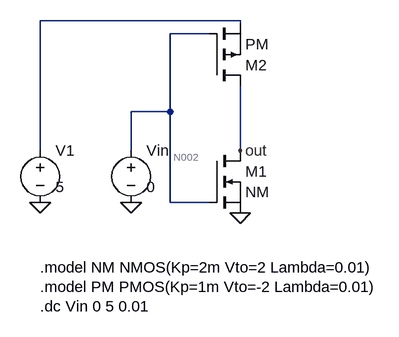
[diagram p0: schematic Ex12.asc]
Ex12.asc, the LTspice schematic file:
Version 4
SHEET 1 880 680
WIRE 60 200 60 0
WIRE 60 0 368 0
WIRE 368 0 368 4
WIRE 368 100 368 200
WIRE 200 200 200 140
WIRE 200 140 260 140
WIRE 260 140 260 20
WIRE 260 20 320 20
WIRE 260 140 260 280
WIRE 260 280 320 280
FLAG 368 200 out
FLAG 60 280 0
FLAG 200 280 0
FLAG 368 296 0
SYMBOL voltage 60 184 R0
WINDOW 0 24 16 Left 2
WINDOW 3 24 72 Left 2
SYMATTR InstName V1
SYMATTR Value 5
SYMBOL voltage 200 184 R0
WINDOW 0 24 16 Left 2
WINDOW 3 24 72 Left 2
SYMATTR InstName Vin
SYMATTR Value 0
SYMBOL pmos 320 100 M180
WINDOW 0 56 32 Left 2
WINDOW 3 56 64 Left 2
SYMATTR InstName M2
SYMATTR Value PM
SYMBOL nmos 320 200 R0
WINDOW 0 56 32 Left 2
WINDOW 3 56 64 Left 2
SYMATTR InstName M1
SYMATTR Value NM
TEXT 60 380 Left 2 !.model NM NMOS(Kp=2m Vto=2 Lambda=0.01)
TEXT 60 410 Left 2 !.model PM PMOS(Kp=1m Vto=-2 Lambda=0.01)
TEXT 60 440 Left 2 !.dc Vin 0 5 0.01

The netlist it stands for:
* Ex12.asc
V1 N001 0 5
Vin N002 0 0
M2 out N002 N001 N001 PM
M1 out N002 0 0 NM
.model NMOS NMOS
.model PMOS PMOS
.lib standard.mos
.model NM NMOS(Kp=2m Vto=2 Lambda=0.01)
.model PM PMOS(Kp=1m Vto=-2 Lambda=0.01)
.dc Vin 0 5 0.01
.backanno
.end

* Results of the author's LTspice run, read from the files saved beside the schematic
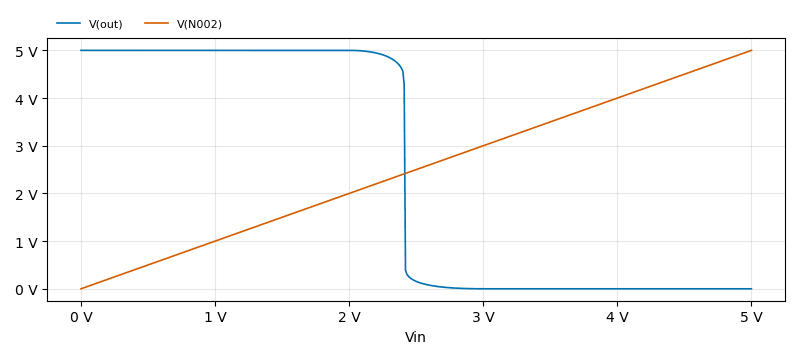
[diagram p1: DC transfer characteristic of Ex12.asc, plotted from the saved traces]
* DC transfer characteristic, 1 run:
*   V(out): 5 V at Vin=0 V, 1.668 nV at Vin=5 V, min 1.668 nV, max 5 V
*   V(N002): 0 V at Vin=0 V, 5 V at Vin=5 V, min 0 V, max 5 V